# Altium project OPTICAL-FLOW-BOARD.PrjPcb
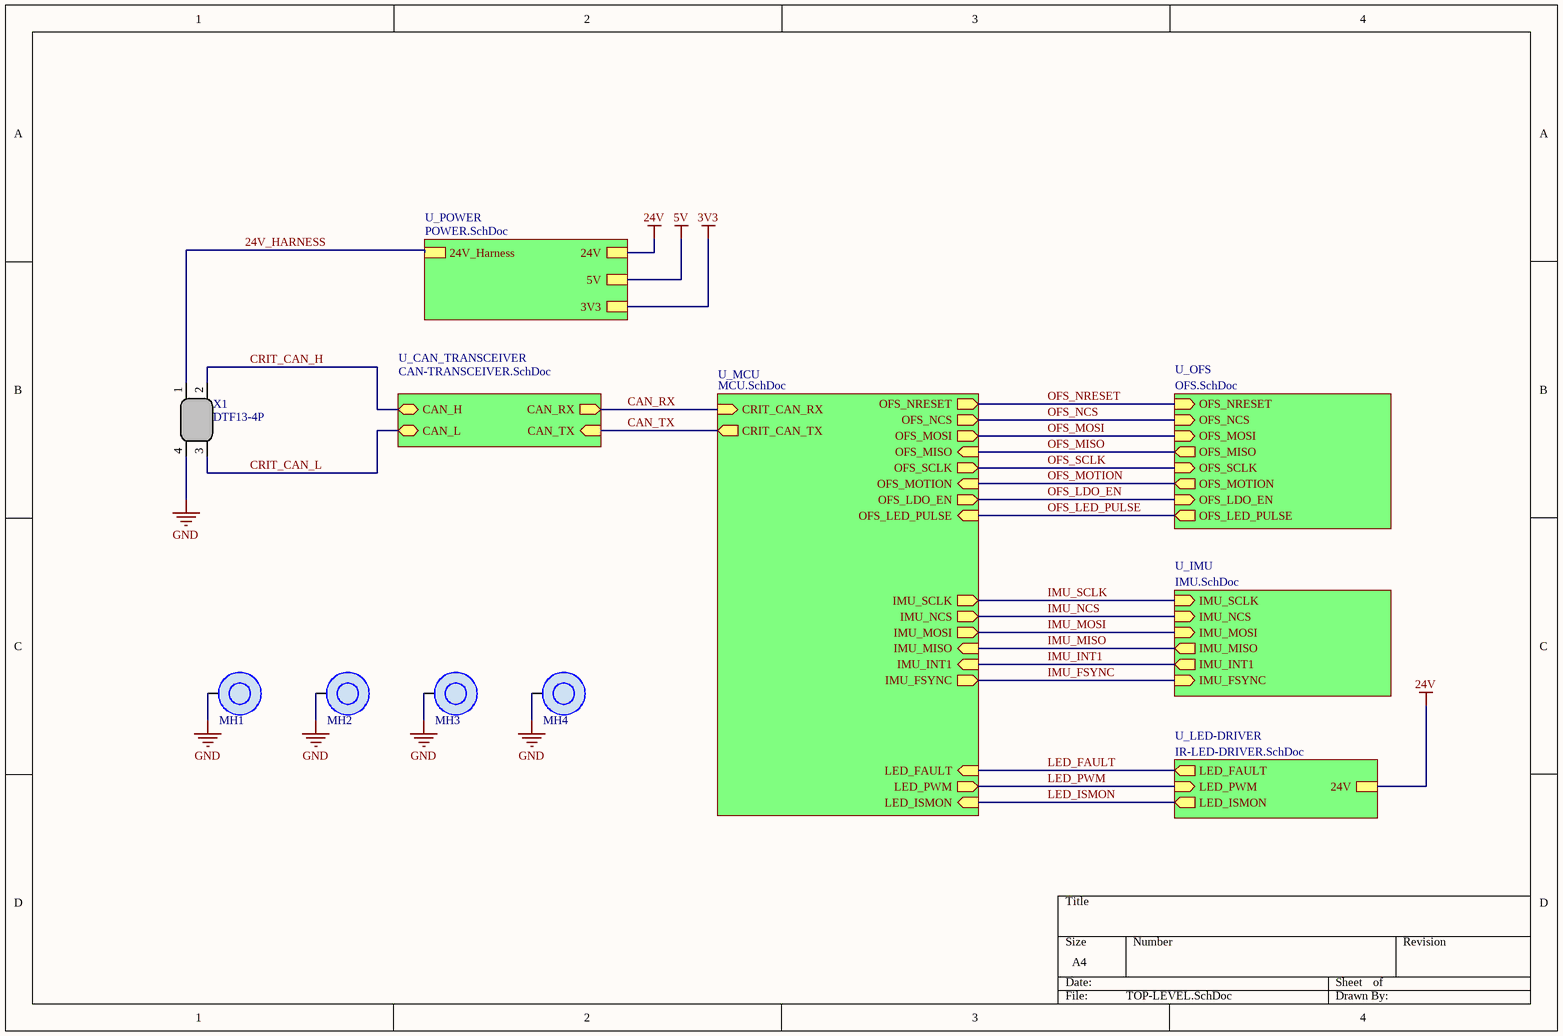
[diagram p0: TOP-LEVEL.SchDoc]
7 sheets, 111 parts. Net scope: hierarchical (ports join the sheet entries above them; power ports are global).
Board file: OFS-BOARD.PcbDoc
Sheets:
  TOP-LEVEL.SchDoc
    U_CAN_TRANSCEIVER = CAN-TRANSCEIVER.SchDoc
    U_POWER = POWER.SchDoc
    U_MCU = MCU.SchDoc
    U_OFS = OFS.SchDoc
    U_IMU = IMU.SchDoc
    U_LED-DRIVER = IR-LED-DRIVER.SchDoc

## Sheet TOP-LEVEL.SchDoc
size A4; SheetNumber: 1; SheetTotal: 7

### Parts
MH1  MOUNTING_HOLE  [MOUNTING_HOLE]  (value not drawn)
MH2  MOUNTING_HOLE  [MOUNTING_HOLE]  (value not drawn)
MH3  MOUNTING_HOLE  [MOUNTING_HOLE]  (value not drawn)
MH4  MOUNTING_HOLE  [MOUNTING_HOLE]  (value not drawn)
X1  DTF13-4P  [DTF13-4P]

### Sub-sheets
U_CAN_TRANSCEIVER = CAN-TRANSCEIVER.SchDoc: CAN_L (bidir), CAN_H (bidir), CAN_TX (in), CAN_RX (out)
U_IMU = IMU.SchDoc: IMU_SCLK (in), IMU_NCS (in), IMU_MOSI (in), IMU_MISO (out), IMU_INT1 (out), IMU_FSYNC (in)
U_LED-DRIVER = IR-LED-DRIVER.SchDoc: LED_ISMON (out), LED_FAULT (out), LED_PWM (in), 24V
U_MCU = MCU.SchDoc: CRIT_CAN_RX (in), CRIT_CAN_TX (out), OFS_NRESET (out), OFS_NCS (out), OFS_LDO_EN (out), OFS_MOTION (in), OFS_SCLK (out), OFS_MISO (in), OFS_MOSI (out), OFS_LED_PULSE (in), LED_ISMON (in), LED_PWM (out), LED_FAULT (in), IMU_FSYNC (out), IMU_INT1 (in), IMU_MISO (in), IMU_MOSI (out), IMU_NCS (out), IMU_SCLK (out)
U_OFS = OFS.SchDoc: OFS_NRESET (in), OFS_MOSI (in), OFS_SCLK (in), OFS_MOTION (out), OFS_LDO_EN (in), OFS_NCS (in), OFS_MISO (out), OFS_LED_PULSE (out)
U_POWER = POWER.SchDoc: 24V, 24V_Harness, 5V, 3V3

### Nets
24V: sheet U_POWER/24V, sheet U_LED-DRIVER/24V
GND: MH1.1 MH2.1 MH3.1 MH4.1 X1.4
24V_HARNESS: X1.1 ; sheet U_POWER/24V_Harness
CAN_RX: sheet U_CAN_TRANSCEIVER/CAN_RX, sheet U_MCU/CRIT_CAN_RX
CAN_TX: sheet U_CAN_TRANSCEIVER/CAN_TX, sheet U_MCU/CRIT_CAN_TX
CRIT_CAN_H: X1.2 ; sheet U_CAN_TRANSCEIVER/CAN_H
CRIT_CAN_L: X1.3 ; sheet U_CAN_TRANSCEIVER/CAN_L
IMU_FSYNC: sheet U_MCU/IMU_FSYNC, sheet U_IMU/IMU_FSYNC
IMU_INT1: sheet U_MCU/IMU_INT1, sheet U_IMU/IMU_INT1
IMU_MISO: sheet U_MCU/IMU_MISO, sheet U_IMU/IMU_MISO
IMU_MOSI: sheet U_MCU/IMU_MOSI, sheet U_IMU/IMU_MOSI
IMU_NCS: sheet U_MCU/IMU_NCS, sheet U_IMU/IMU_NCS
IMU_SCLK: sheet U_MCU/IMU_SCLK, sheet U_IMU/IMU_SCLK
LED_FAULT: sheet U_MCU/LED_FAULT, sheet U_LED-DRIVER/LED_FAULT
LED_ISMON: sheet U_MCU/LED_ISMON, sheet U_LED-DRIVER/LED_ISMON
LED_PWM: sheet U_MCU/LED_PWM, sheet U_LED-DRIVER/LED_PWM
OFS_LDO_EN: sheet U_MCU/OFS_LDO_EN, sheet U_OFS/OFS_LDO_EN
OFS_LED_PULSE: sheet U_MCU/OFS_LED_PULSE, sheet U_OFS/OFS_LED_PULSE
OFS_MISO: sheet U_MCU/OFS_MISO, sheet U_OFS/OFS_MISO
OFS_MOSI: sheet U_MCU/OFS_MOSI, sheet U_OFS/OFS_MOSI
OFS_MOTION: sheet U_MCU/OFS_MOTION, sheet U_OFS/OFS_MOTION
OFS_NCS: sheet U_MCU/OFS_NCS, sheet U_OFS/OFS_NCS
OFS_NRESET: sheet U_MCU/OFS_NRESET, sheet U_OFS/OFS_NRESET
OFS_SCLK: sheet U_MCU/OFS_SCLK, sheet U_OFS/OFS_SCLK

### Library data of the parts
X1 = TE_DTF13-4P: Connector Header Through Hole, Right Angle 4 position 0.175" (4.44mm); ComponentLink1Description: Datasheet; ComponentLink1URL: https://www.te.com/usa-en/product-DTF13-4P.html; ComponentLink2Description: Digikey; ComponentLink2URL: https://www.digikey.com/en/products/detail/te-connectivity-deutsch-connectors/DTF13-4P/7220163

## Sheet CAN-TRANSCEIVER.SchDoc
size A4; SheetNumber: 4; SheetTotal: 7
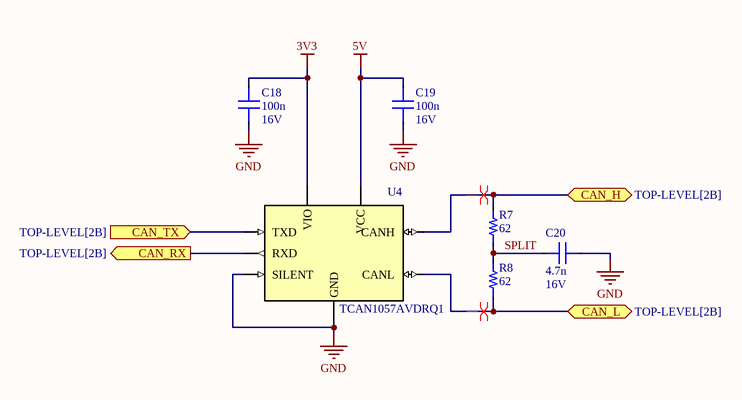
[diagram p1: CAN-TRANSCEIVER.SchDoc]

### Parts
C18  value 100n  Voltage: 16V  [0603_CAP]  (hidden comment: Capacitor)
C19  value 100n  Voltage: 16V  [0603_CAP]  (hidden comment: Capacitor)
C20  value 4.7n  Voltage: 16V  [0603_CAP]  (hidden comment: Capacitor)
R7  value 62  [0603_RES]  (hidden comment: Resistor)
R8  value 62  [0603_RES]  (hidden comment: Resistor)
U4  TCAN1057AVDRQ1  [SOIC8_D_TEX]

### Ports
CAN_H (bidir, see TOP-LEVEL[2B]), CAN_L (bidir, see TOP-LEVEL[2B]), CAN_RX (out, see TOP-LEVEL[2B]), CAN_TX (in, see TOP-LEVEL[2B])

### Nets
3V3: C18.2 U4.5(VIO)
5V: C19.2 U4.3(VCC)
GND: C18.1 C19.1 C20.2 U4.2(GND) U4.8(SILENT)
CAN_RX: U4.4(RXD) ; port CAN_RX
CAN_TX: U4.1(TXD) ; port CAN_TX
CRIT_CAN_H: R7.2 U4.7(CANH) ; port CAN_H
CRIT_CAN_L: R8.1 U4.6(CANL) ; port CAN_L
SPLIT: C20.1 R7.1 R8.2

### Layout directives
differential pair: CRIT_CAN_H, CRIT_CAN_L

### Library data of the parts
U4 = TCAN1057AVDRQ1: CAN transceiver with silent mode 8-SOIC Bus Protected; Manufacturer_Name: Texas Instruments; Type: Interface; Copyright: Copyright (C) 2025 Ultra Librarian. All rights reserved.; Manufacturer_Part_Number: TCAN1057AVDRQ1; RefDes: RefDes; ComponentLink1Description: Datasheet; ComponentLink1URL: https://www.ti.com/lit/ds/symlink/tcan1057a-q1.pdf
C18-C20 = Capacitor: Dielectric: *; Percent Tolerance: *; ESR: *
R7 R8 = Resistor: Tolerance: *

## Sheet POWER.SchDoc
size A4; SheetNumber: 5; SheetTotal: 7
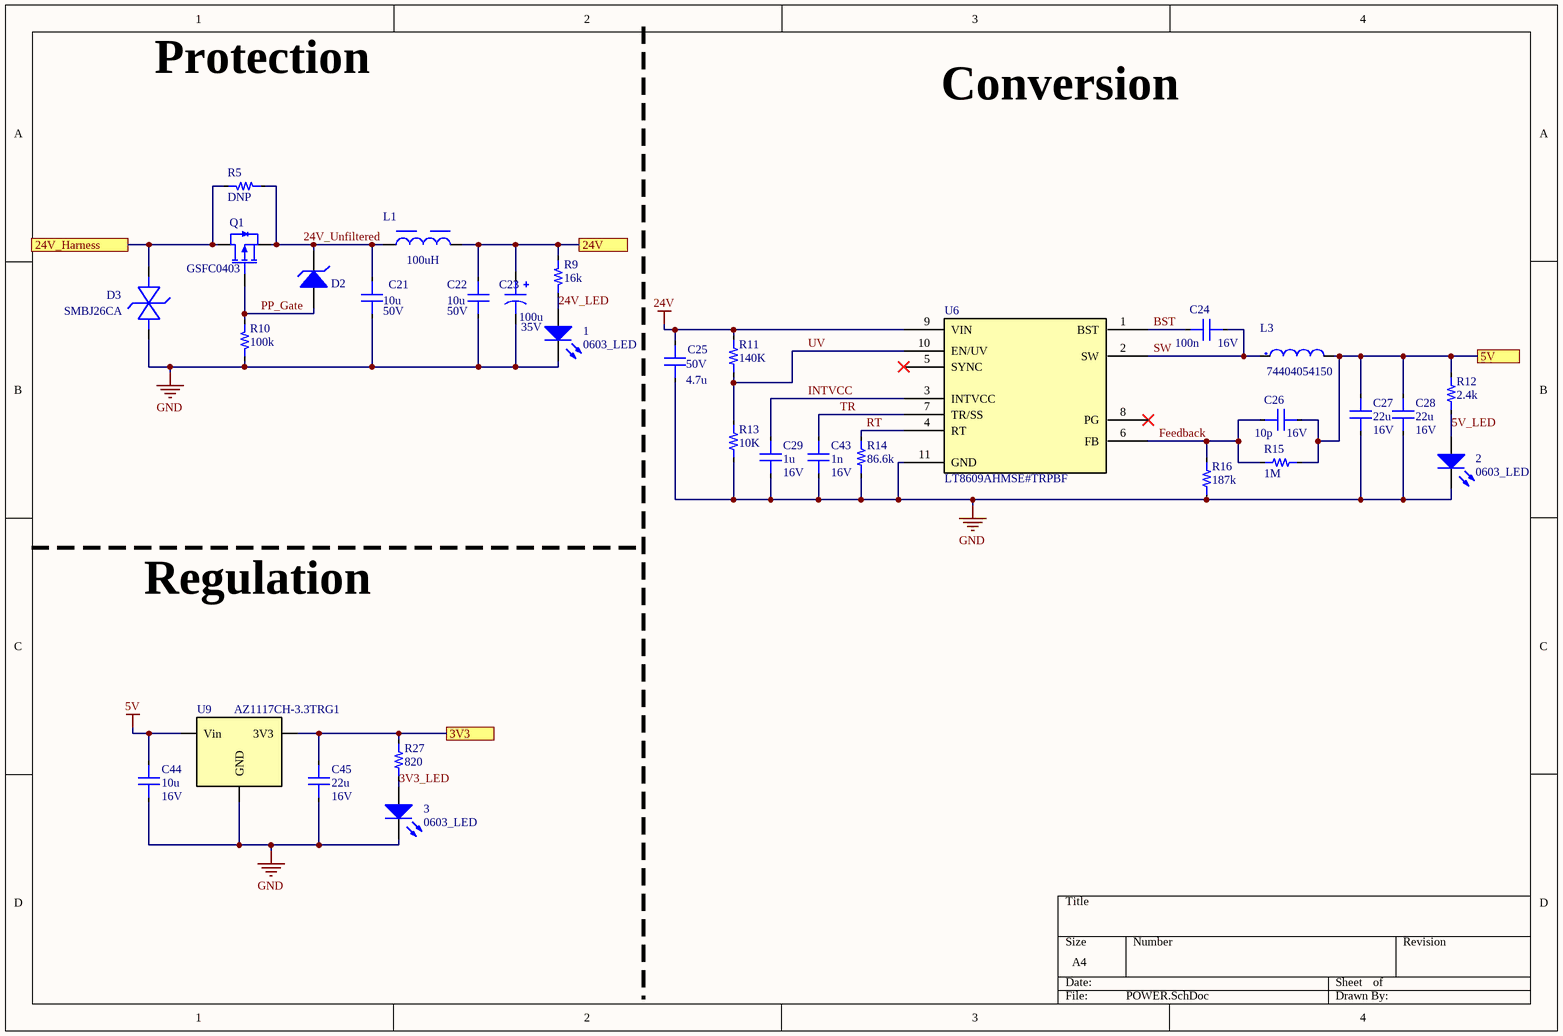
[diagram p2: POWER.SchDoc]

### Parts
1  0603_LED  [0603_LED]
2  0603_LED  [0603_LED]
3  0603_LED  [0603_LED]
C21  value 10u  Voltage: 50V  [0603_CAP]  (hidden comment: Capacitor)
C22  value 10u  Voltage: 50V  [0603_CAP]  (hidden comment: Capacitor)
C23  100u  Voltage Rating: 35V  [WCAP-PSHP_D8H8.7]
C24  value 100n  Voltage: 16V  [0603_CAP]  (hidden comment: Capacitor)
C25  Voltage: 50V  Vaule: 4.7u  [1206_CAP]  (hidden comment: GRM319R61H475KA12D)
C26  value 10p  Voltage: 16V  [0603_CAP]  (hidden comment: Capacitor)
C27  Vaule: 22u  Voltage: 16V  [1206_CAP]  (hidden comment: GRM319R61C226KE15D)
C28  Vaule: 22u  Voltage: 16V  [1206_CAP]  (hidden comment: GRM319R61C226KE15D)
C29  value 1u  Voltage: 16V  [0603_CAP]  (hidden comment: Capacitor)
C43  value 1n  Voltage: 16V  [0603_CAP]  (hidden comment: Capacitor)
C44  value 10u  Voltage: 16V  [0603_CAP]  (hidden comment: Capacitor)
C45  value 22u  Voltage: 16V  [0603_CAP]  (hidden comment: Capacitor)
D2  MMSZ5231B-7-F  [SOD-123]  (value not drawn)
D3  SMBJ26CA  [SMBJ26CA]
L1  100uH  [WE-LQS_3015]
L3  74404054150  [74404054150]
Q1  GSFC0403  [SSM3J351R,LF]
R5  value DNP  [0603_RES]  (hidden comment: Resistor)
R9  value 16k  [0603_RES]  (hidden comment: Resistor)
R10  value 100k  [0603_RES]  (hidden comment: Resistor)
R11  value 140K  [0603_RES]  (hidden comment: Resistor)
R12  value 2.4k  [0603_RES]  (hidden comment: Resistor)
R13  value 10K  [0603_RES]  (hidden comment: Resistor)
R14  value 86.6k  [0603_RES]  (hidden comment: Resistor)
R15  value 1M  [0603_RES]  (hidden comment: Resistor)
R16  value 187k  [0603_RES]  (hidden comment: Resistor)
R27  value 820  [0603_RES]  (hidden comment: Resistor)
U6  LT8609AHMSE#TRPBF  [05-08-1664_ADI]
U9  AZ1117CH-3.3TRG1  [SOT-233-4]

### Ports
3V3 (see TOP-LEVEL[2B]), 5V (see TOP-LEVEL[2B]), 24V (see TOP-LEVEL[2A], IR-LED-DRIVER[1B]), 24V_Harness (see TOP-LEVEL[2A])

### Nets
3V3: C45.2 R27.2 U9.2,_4(3V3) ; port 3V3
5V: C26.2 C27.2 C28.2 C44.2 L3.2 R12.2 R15.1 U9.3(Vin) ; port 5V
24V: C22.2 C23.1 C25.2 L1.2 R9.2 R11.2 U6.9(VIN) ; port 24V
GND: 1.1(C) 2.1(C) 3.1(C) C21.1 C22.1 C23.2 C25.1 C27.1 C28.1 C29.1 C43.1 C44.1 C45.1 D3.1 R10.1 R13.1 R14.1 R16.2 U6.11(GND) U9.1(GND)
3V3_LED: 3.2(A) R27.1
5V_LED: 2.2(A) R12.1
24V_HARNESS: D3.2 Q1.3(D) R5.2 ; port 24V_Harness
24V_LED: 1.2(A) R9.1
24V_Unfiltered: C21.2 D2.1(K) L1.1 Q1.2(S) R5.1
BST: C24.2 U6.1(BST)
Feedback: C26.1 R15.2 R16.1 U6.6(FB)
INTVCC: C29.2 U6.3(INTVCC)
PP_Gate: D2.2(A) Q1.1(G) R10.2
RT: R14.2 U6.4(RT)
SW: C24.1 L3.1 U6.2(SW)
TR: C43.2 U6.7(TR/SS)
UV: R11.1 R13.2 U6.10(EN/UV)

Not connected (* = marked no-connect by the designer): U6 5(SYNC)* 8(PG)*

### Notes on the sheet
- Protection
- Conversion
- Regulation

### Library data of the parts
1-3 = 0603_LED: WL-SMCW Mono-color Chip LED Waterclear, SMT, size 0603, Blue, 3.2V, 140°; Manufacturer Part Number: 150060BS75000; Manufacturer: Wurth Elektronik; Case/Size Code: 0603; Chip Technology: InGaN; Dominant Wavelength: 470nm; Luminous Intensity: 145mcd; Peak Wavelength: 465nm; Category: Signal LEDs; Match Code: WL-SMCW; ComponentLink1Description: Website Link; ComponentLink1URL: https://www.we-online.com/redexpert/article/150060BS75000?ad; ComponentLink2Description: Datasheet Link; ComponentLink2URL: https://www.we-online.com/redexpert/spec/150060BS75000?ad; Mount: Surface Mount; Operating Temperature Max: 85°C; Operating Temperature Min: -40°C; Packaging: Tape and Reel; Length: 1.6mm; Width: 0.8mm; Height: 0.7mm; Emitting Color: Blue; Forward Voltage: 3.2V; Viewing Angle: 140°
C23 = 875115652007: Cap, 100uf, 35V, Alu Elec Smd, Polymer Rohs Compliant Wurth Elektronik 875115652007; Pitch: 3.1mm; Capacitance: 100µF; Leakage Current: 700µA; ESR (Equivalent Series Resistance): 30mΩ; Ripple Current: 3A; Width: 8.3mm; Length: 8.7mm; Min Operating Temperature: -55°C; RoHS: Compliant; Diameter: 8mm; Max Operating Temperature: 105°C; ComponentLink1Description: Digikey; ComponentLink1URL: https://www.digikey.com/en/products/detail/würth-elektronik/875115652007/8556615
C25 = GRM319R61H475KA12D: CAP CER 4.7UF 50V X5R 1206; ComponentLink1Description: Digikey; ComponentLink1URL: https://www.digikey.com/en/products/detail/murata-electronics/GRM319R61H475KA12D/6606013
C27 C28 = GRM319R61C226KE15D: CAP CER 22UF 16V X5R 1206; ComponentLink1Description: Digikey; ComponentLink1URL: https://www.digikey.com/en/products/detail/murata-electronics/GRM319R61C226KE15D/8323879
D2 = MMSZ5231B-7-F: Zener Diode 5.1V 500mW ±5% Surface Mount SOD-123; Num_Circuits: 1; Package: SOD-123; ComponentLink1Description: Digikey; ComponentLink1URL: https://www.digikey.com/en/products/detail/diodes-incorporated/MMSZ5231B-7-F/755472
D3 = SMBJ26CA: 42.1V Clamp 14.3A Ipp Tvs Diode Surface Mount DO-214AA (SMBJ); ComponentLink1Description: Digikey; ComponentLink1URL: https://www.digikey.com/en/products/detail/littelfuse-inc/SMBJ26CA/286000
L1 = 74404032101: WE-LQS SMT Power Inductor, size 3015, 100μH, 1.9Ω; Manufacturer: Wurth Elektronik; Case/Size Code: 3015; Rated Current: 0.3A; Saturation Current: 0.26A; Self Resonant Frequency: 7.5MHz; Manufacturer Part Number: 74404032101; Category: Power Inductors; Match Code: WE-LQS; ComponentLink1Description: Website Link; ComponentLink1URL: https://www.we-online.com/redexpert/article/74404032101?ad; ComponentLink2Description: Datasheet Link; ComponentLink2URL: https://www.we-online.com/redexpert/spec/74404032101?ad; Mount: Surface Mount; Min Operating Temperature: -40°C; Max Operating Temperature: 125°C; Packaging: Tape and Reel; Length: 3mm; Width: 3mm; Height: 1.5mm; DC Resistance: 1.9Ω; Inductance: 100μH
L3 = 74404054150: Inductor Power Semi-Shielded Wirewound 15uH 20% 100KHz 2A 0.086Ohm DCR 2020 Automotive T/R; Saturation Current: 2.2A; Core Material: Ferrite; DC Resistance (DCR): 86mΩ; Self Resonant Frequency: 22MHz; Inductance: 15µH; Width: 5mm; Max Operating Temperature: 125°C; Case/Package: Nonstandard; REACH SVHC: Unknown; Height: 4mm; Min Operating Temperature: -40°C; Composition: Wirewound; Height - Seated (Max): 3.9878mm; RMS Current (Irms): 2A; Max DC Current: 2A; Length: 5mm; Inductance Tolerance: 20%; Test Frequency: 100kHz; Mount: Surface Mount; Termination: SMD/SMT; Tolerance: 20%; Current Rating: 2A; Ambient Temperature Range Low: -40°C; Ambient Temperature Range High: 85°C; RoHS: Compliant; Shielding: Shielded; ComponentLink1Description: Digikey; ComponentLink1URL: https://www.digikey.com/en/products/detail/würth-elektronik/74404054150/4865666
Q1 = GSFC0403: MOSFET P-CH 40V 2.9A SOT-23F; ComponentLink1Description: Digikey; ComponentLink1URL: https://goodarksemi.com/docs/datasheets/mosfets/GSFC0403.pdf
U6 = LT8609AHMSETRPBF: Buck Switching Regulator IC Positive Adjustable 0.782V 1 Output 3A 10-TFSOP, 10-MSOP (0.118", 3.00mm Width) Exposed Pad; Manufacturer_Name: Analog Devices Inc; Type: Power Management; Copyright: Copyright (C) 2025 Ultra Librarian. All rights reserved.; Manufacturer_Part_Number: LT8609AHMSE#TRPBF; RefDes: RefDes
U9 = AZ1117CH-3.3TRG1: No Description Available; Manufacturer_Name: Diodes Inc; Copyright: Copyright (C) 2025 Ultra Librarian. All rights reserved.; Manufacturer_Part_Number: AZ1117CH-3.3TRG1; RefDes: RefDes; Type: Type
C21 C22 C24 C26 C29 C43-C45 = Capacitor: Dielectric: *; Percent Tolerance: *; ESR: *
R5 R9-R16 R27 = Resistor: Tolerance: *

## Sheet MCU.SchDoc
size A4; SheetNumber: 2; SheetTotal: 7
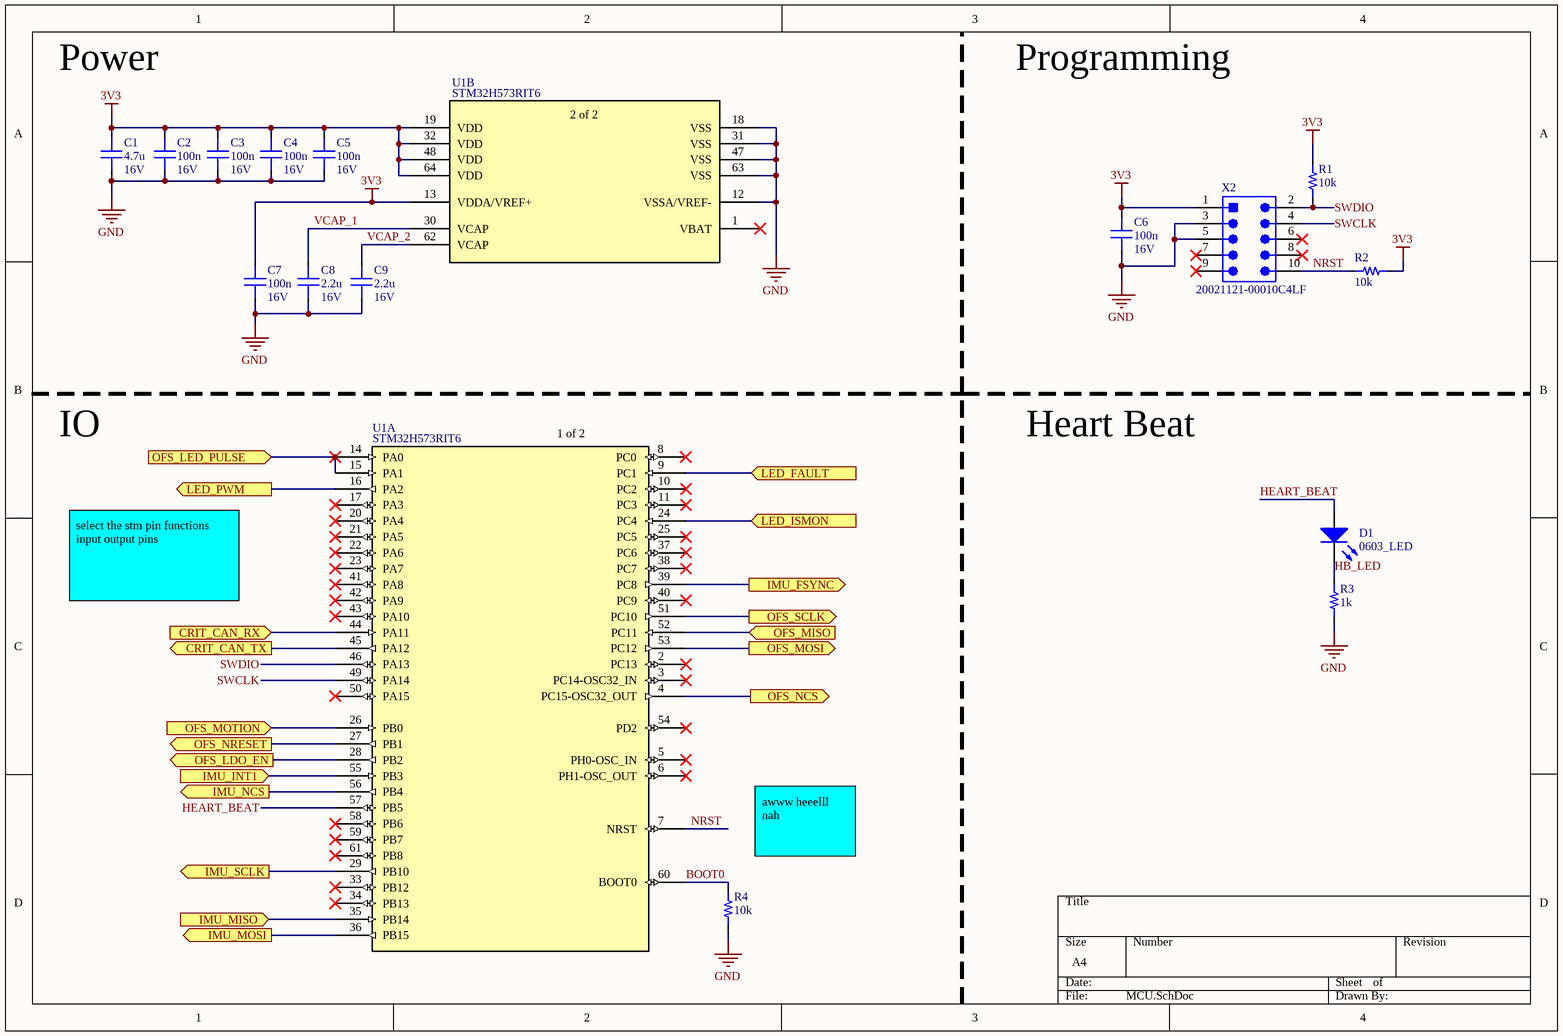
[diagram p3: MCU.SchDoc]

### Parts
C1  value 4.7u  Voltage: 16V  [0603_CAP]  (hidden comment: Capacitor)
C2  value 100n  Voltage: 16V  [0603_CAP]  (hidden comment: Capacitor)
C3  value 100n  Voltage: 16V  [0603_CAP]  (hidden comment: Capacitor)
C4  value 100n  Voltage: 16V  [0603_CAP]  (hidden comment: Capacitor)
C5  value 100n  Voltage: 16V  [0603_CAP]  (hidden comment: Capacitor)
C6  value 100n  Voltage: 16V  [0603_CAP]  (hidden comment: Capacitor)
C7  value 100n  Voltage: 16V  [0603_CAP]  (hidden comment: Capacitor)
C8  value 2.2u  Voltage: 16V  [0603_CAP]  (hidden comment: Capacitor)
C9  value 2.2u  Voltage: 16V  [0603_CAP]  (hidden comment: Capacitor)
D1  0603_LED  [0603_LED]
R1  value 10k  [0603_RES]  (hidden comment: Resistor)
R2  value 10k  [0603_RES]  (hidden comment: Resistor)
R3  value 1k  [0603_RES]  (hidden comment: Resistor)
R4  value 10k  [0603_RES]  (hidden comment: Resistor)
U1  STM32H573RIT6  [LQFP64-10x10mm_STM]  (parts A,B of 2)
X2  20021121-00010C4LF  [HDR2X5_SMT]

### Ports
CRIT_CAN_RX (in, see TOP-LEVEL[2B]), CRIT_CAN_TX (out, see TOP-LEVEL[2B]), IMU_FSYNC (out, see TOP-LEVEL[3C], IMU[1B]), IMU_INT1 (in, see TOP-LEVEL[3C], IMU[1B]), IMU_MISO (in, see TOP-LEVEL[3C], IMU[3B]), IMU_MOSI (out, see TOP-LEVEL[3C], IMU[3B]), IMU_NCS (out, see TOP-LEVEL[3C], IMU[1B]), IMU_SCLK (out, see TOP-LEVEL[3C], IMU[3B]), LED_FAULT (in, see TOP-LEVEL[3C], IR-LED-DRIVER[2C]), LED_ISMON (in, see TOP-LEVEL[3D], IR-LED-DRIVER[3B]), LED_PWM (out, see TOP-LEVEL[3D], IR-LED-DRIVER[1B]), OFS_LDO_EN (out, see TOP-LEVEL[3B], OFS[3C]), OFS_LED_PULSE (in, see TOP-LEVEL[3B], OFS[4B]), OFS_MISO (in, see TOP-LEVEL[3B], OFS[3C]), OFS_MOSI (out, see TOP-LEVEL[3B], OFS[3C]), OFS_MOTION (in, see TOP-LEVEL[3B], OFS[3C]), OFS_NCS (out, see TOP-LEVEL[3B], OFS[3B]), OFS_NRESET (out, see TOP-LEVEL[3B], OFS[3B]), OFS_SCLK (out, see TOP-LEVEL[3B], OFS[3C])

### Nets
3V3: C1.1 C2.1 C3.1 C4.1 C5.1 C6.1 C7.1 R1.1 R2.2 U1.13(VDDA/VREF+) U1.19(VDD) U1.32(VDD) U1.48(VDD) U1.64(VDD) X2.1
GND: C1.2 C2.2 C3.2 C4.2 C5.2 C6.2 C7.2 C8.2 C9.2 R3.1 R4.1 U1.12(VSSA/VREF-) U1.18(VSS) U1.31(VSS) U1.47(VSS) U1.63(VSS) X2.3 X2.5
BOOT0: R4.2 U1.60(BOOT0)
CAN_RX: U1.44(PA11) ; port CRIT_CAN_RX
CAN_TX: U1.45(PA12) ; port CRIT_CAN_TX
HB_LED: D1.1(C) R3.2
HEART_BEAT: D1.2(A) U1.57(PB5)
IMU_FSYNC: U1.39(PC8) ; port IMU_FSYNC
IMU_INT1: U1.55(PB3) ; port IMU_INT1
IMU_MISO: U1.35(PB14) ; port IMU_MISO
IMU_MOSI: U1.36(PB15) ; port IMU_MOSI
IMU_NCS: U1.56(PB4) ; port IMU_NCS
IMU_SCLK: U1.29(PB10) ; port IMU_SCLK
LED_FAULT: U1.9(PC1) ; port LED_FAULT
LED_ISMON: U1.24(PC4) ; port LED_ISMON
LED_PWM: U1.16(PA2) ; port LED_PWM
NRST: R2.1 U1.7(NRST) X2.10
OFS_LDO_EN: U1.28(PB2) ; port OFS_LDO_EN
OFS_LED_PULSE: U1.14(PA0) U1.15(PA1) ; port OFS_LED_PULSE
OFS_MISO: U1.52(PC11) ; port OFS_MISO
OFS_MOSI: U1.53(PC12) ; port OFS_MOSI
OFS_MOTION: U1.26(PB0) ; port OFS_MOTION
OFS_NCS: U1.4(PC15-OSC32_OUT) ; port OFS_NCS
OFS_NRESET: U1.27(PB1) ; port OFS_NRESET
OFS_SCLK: U1.51(PC10) ; port OFS_SCLK
SWCLK: U1.49(PA14) X2.4
SWDIO: R1.2 U1.46(PA13) X2.2
VCAP_1: C8.1 U1.30(VCAP)
VCAP_2: C9.1 U1.62(VCAP)

Not connected (* = marked no-connect by the designer): U1 1(VBAT)* 2(PC13)* 3(PC14-OSC32_IN)* 5(PH0-OSC_IN)* 6(PH1-OSC_OUT)* 8(PC0)* 10(PC2)* 11(PC3)* 17(PA3)* 20(PA4)* 21(PA5)* 22(PA6)* 23(PA7)* 25(PC5)* 33(PB12)* 34(PB13)* 37(PC6)* 38(PC7)* 40(PC9)* 41(PA8)* 42(PA9)* 43(PA10)* 50(PA15)* 54(PD2)* 58(PB6)* 59(PB7)* 61(PB8)*; X2 6* 7* 8* 9*

### Notes on the sheet
- Power
- Programming
- IO
- Heart Beat
- select the stm pin functions
  input output pins
- (near R4) awww heeelll nah
- (in symbol STM32H573RIT6, part A) 1 of 2
- (in symbol STM32H573RIT6, part B) 2 of 2

### Library data of the parts
D1 = 0603_LED: as 1 on sheet POWER; Category: Signal LEDs; Match Code: WL-SMCW; ComponentLink1Description: Website Link; ComponentLink1URL: https://www.we-online.com/redexpert/article/150060BS75000?ad; ComponentLink2Description: Datasheet Link; ComponentLink2URL: https://www.we-online.com/redexpert/spec/150060BS75000?ad; Mount: Surface Mount; Operating Temperature Max: 85°C; Operating Temperature Min: -40°C; Packaging: Tape and Reel; Length: 1.6mm; Width: 0.8mm; Height: 0.7mm; Emitting Color: Blue; Forward Voltage: 3.2V; Viewing Angle: 140°
U1 = STM32H573RIT6: Mfr_Name: STMicroelectronics; RefDes: RefDes; Type: Type
X2 = 20021121-00010C4LF: Header, 10-Leads, Body 3.43x6.35mm, Pitch 1.27mm; Circuits: 10; Name: 20021121-00010C4LF; ComponentLink1Description: Digikey; ComponentLink1URL: https://www.digikey.com/product-detail/en/amphenol-icc-fci/20021121-00010C4LF/609-3695-1-ND/2209147
C1-C9 = Capacitor: Dielectric: *; Percent Tolerance: *; ESR: *
R1-R4 = Resistor: Tolerance: *

## Sheet OFS.SchDoc
size A4; SheetNumber: 3; SheetTotal: 7
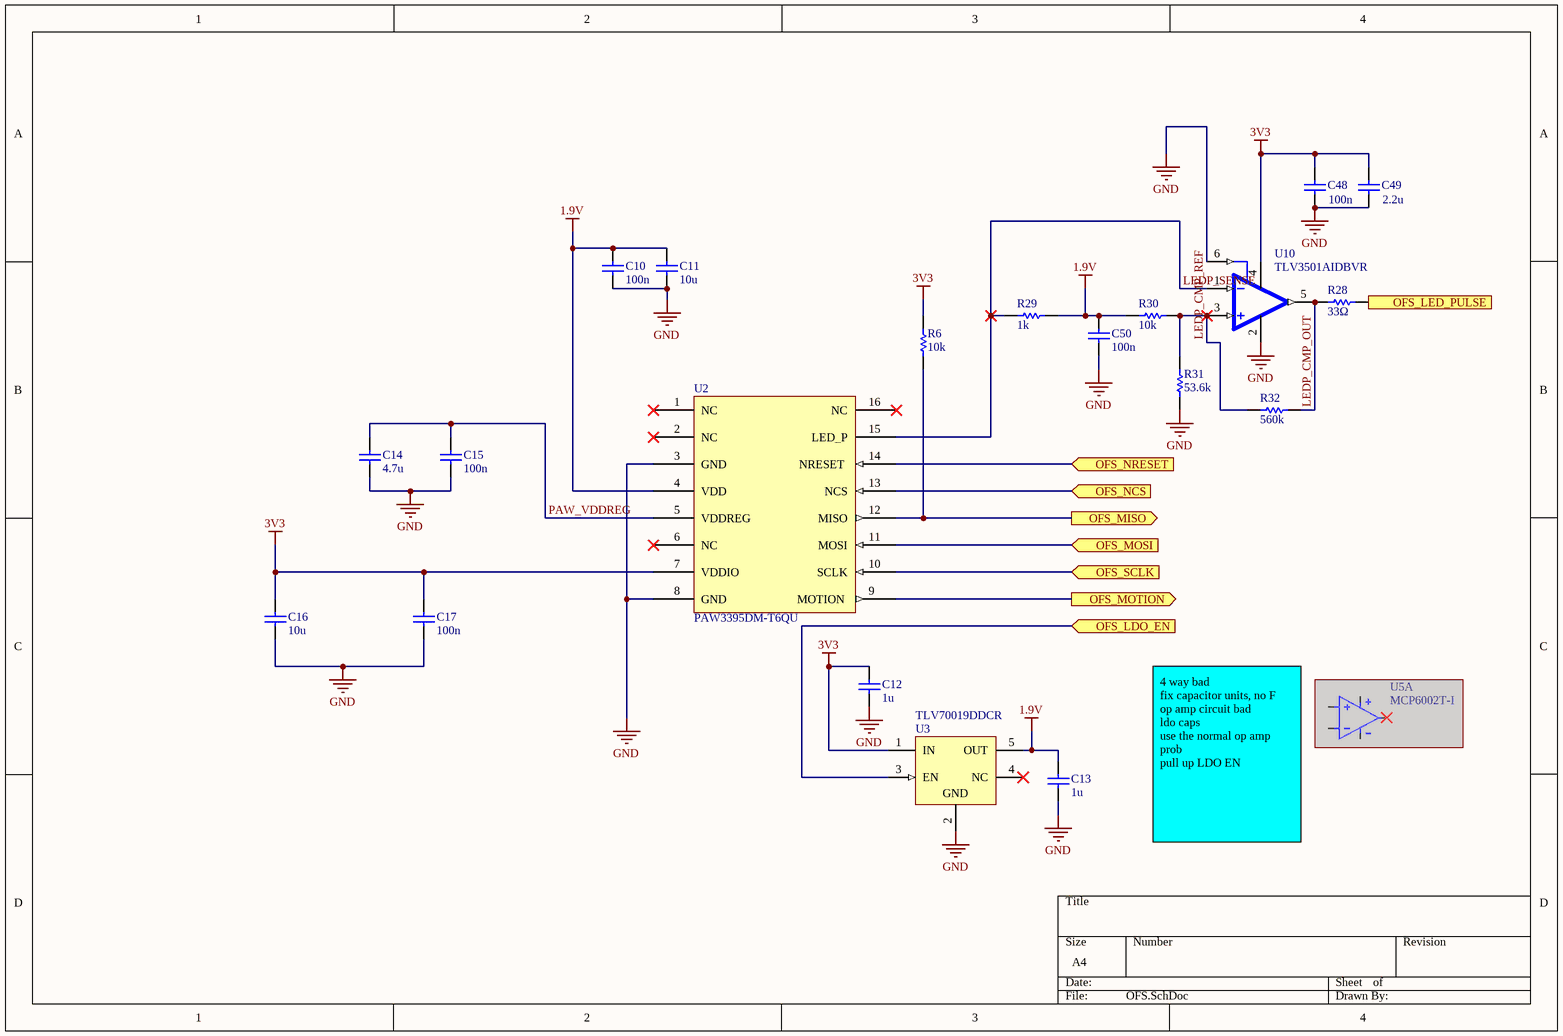
[diagram p4: OFS.SchDoc]

### Parts
C10  value 100n  [0603_CAP]  (hidden comment: Capacitor)
C11  value 10u  [0603_CAP]  (hidden comment: Capacitor)
C12  value 1u  [0603_CAP]  (hidden comment: Capacitor)
C13  value 1u  [0603_CAP]  (hidden comment: Capacitor)
C14  value 4.7u  [0603_CAP]  (hidden comment: Capacitor)
C15  value 100n  [0603_CAP]  (hidden comment: Capacitor)
C16  value 10u  [0603_CAP]  (hidden comment: Capacitor)
C17  value 100n  [0603_CAP]  (hidden comment: Capacitor)
C48  value 100n  [0603_CAP]  (hidden comment: Capacitor)
C49  value 2.2u  [0603_CAP]  (hidden comment: Capacitor)
C50  value 100n  [0603_CAP]  (hidden comment: Capacitor)
R6  value 10k  [0603_RES]  (hidden comment: Resistor)
R28  value 33Ω  [0603_RES]  (hidden comment: Resistor)
R29  value 1k  [0603_RES]  (hidden comment: Resistor)
R30  value 10k  [0603_RES]  (hidden comment: Resistor)
R31  value 53.6k  [0603_RES]  (hidden comment: Resistor)
R32  value 560k  [0603_RES]  (hidden comment: Resistor)
U2  PAW3395DM-T6QU  [PAW3395DM-T6QU]
U3  TLV70019DDCR  [DDC0005A_L]
U5  MCP6002T-I  [SOIC-8]  (part A of 2)  (masked out: inside a compile mask, not in the netlist)
U10  TLV3501AIDBVR  [SOT95P280X145-6N]

### Ports
OFS_LDO_EN (in, see TOP-LEVEL[4B], MCU[1C]), OFS_LED_PULSE (out, see TOP-LEVEL[4B], MCU[1B]), OFS_MISO (out, see TOP-LEVEL[4B], MCU[2C]), OFS_MOSI (in, see TOP-LEVEL[4B], MCU[2C]), OFS_MOTION (out, see TOP-LEVEL[4B], MCU[1C]), OFS_NCS (in, see TOP-LEVEL[4B], MCU[2C]), OFS_NRESET (in, see TOP-LEVEL[4B], MCU[1C]), OFS_SCLK (in, see TOP-LEVEL[4B], MCU[2C])

### Nets
1.9V: C10.2 C11.2 C13.2 C50.2 R29.1 R30.2 U2.4(VDD) U3.5(OUT)
3V3: C12.2 C16.2 C17.2 C48.2 C49.2 R6.2 U2.7(VDDIO) U3.1(IN) U10.4(V+)
GND: C10.1 C11.1 C12.1 C13.1 C14.1 C15.1 C16.1 C17.1 C48.1 C49.1 C50.1 R31.2 U2.3(GND) U2.8(GND) U3.2(GND) U10.2(V-) U10.6(SHDN)
LEDP_CMP_OUT: R28.2 R32.1 U10.5(OUT)
LEDP_CMP_REF: R30.1 R31.1 R32.2 U10.3(+IN)
LEDP_SENSE: R29.2 U2.15(LED_P) U10.1(-IN)
OFS_LDO_EN: U3.3(EN) ; port OFS_LDO_EN
OFS_LED_PULSE: R28.1 ; port OFS_LED_PULSE
OFS_MISO: R6.1 U2.12(MISO) ; port OFS_MISO
OFS_MOSI: U2.11(MOSI) ; port OFS_MOSI
OFS_MOTION: U2.9(MOTION) ; port OFS_MOTION
OFS_NCS: U2.13(NCS) ; port OFS_NCS
OFS_NRESET: U2.14(NRESET) ; port OFS_NRESET
OFS_SCLK: U2.10(SCLK) ; port OFS_SCLK
PAW_VDDREG: C14.2 C15.2 U2.5(VDDREG)

Not connected (* = marked no-connect by the designer): U2 1(NC)* 2(NC)* 6(NC)* 16(NC)*; U3 4(NC)*

### Notes on the sheet
- (near U5) 4 way bad
  fix capacitor units, no F
  op amp circuit bad
  ldo caps
  use the normal op amp prob
  pull up LDO EN

### Library data of the parts
C10-C17 C48-C50 = Capacitor: SimulationGenericComponent: True
R6 R28-R32 = Resistor: TC1: 0; SimulationGenericComponent: True; TC2: 0
U2 = PAW3395DM-T6QU: PixArt PAW3395DM-T6QU optical navigation sensor, 16-pin molded lead-frame DIP, 1.78mm pitch staggered dual row, 10.7mm row spacing, through-hole
U3 = CMP-0394-01054-2: Single Output LDO, 200 mA, Fixed 1.9 V Output, 2 to 5.5 V Input, with Low IQ, 5-pin SOT (DDC), -40 to 125 degC, Green (RoHS & no Sb/Br); Manufacturer: Texas Instruments; Iq(Typ)(mA): 0.03; Vin(Max)(V): 5.5; Accuracy(%): 2; Vout Adj(Min)(V): 1.9; Iout(Max)(A): 0.2; SubFamily: Single Channel LDO; Vdo(Typ)(mV): 175; ComponentLink2Description: Datasheet; PackageReference: DDC0005A; DatasheetVersion: SLVSA00D; ComponentLink3Description: Package Specification; ComponentLink2URL: http://www.ti.com/general/docs/lit/getliterature.tsp?genericPartNumber=TLV70019&fileType=pdf; PartNumber: TLV70019DDCR; PackageVersion: 4204403-2/E; Code_JEDEC: MO-193; ComponentLink1URL: http://www.ti.com/; Eco-Plan: Green (RoHS & no Sb/Br); PackageDescription: 5-Pin Plastic Small Outline, Body 2.9 x 1.6 mm, 0.95 mm Pitch; Fixed Output Options(V): 1.9; Vout Adj(Max)(V): 1.9; Vin(Min)(V): 2; Mounting Technology: Surface Mount; ComponentLink1Description: Manufacturer URL; ComponentLink3URL: http://www.ti.com/litv/pdf/mpds123d
U5 = MCP6002T-I: Num_Circuits: 2; Voltage: 6; Link: https://www.digikey.com/product-detail/en/microchip-technology/MCP6002T-I-SN/MCP6002T-I-SNCT-ND/4307905
U10 = TLV3501AIDBVR: 4.5ns, Rail-to-Rail, High Speed Comparator with Shutdown; MF: Texas Instruments; SnapEDA_Link: https://www.snapeda.com/parts/TLV3501AIDBVR/Texas+Instruments/view-part/?ref=snap; Package: SOT-23-6 Texas Instruments; Value: *; MP: TLV3501AIDBVR; Check_prices: https://www.snapeda.com/parts/TLV3501AIDBVR/Texas+Instruments/view-part/?ref=eda

## Sheet IMU.SchDoc
size A4; SheetNumber: 6; SheetTotal: 7
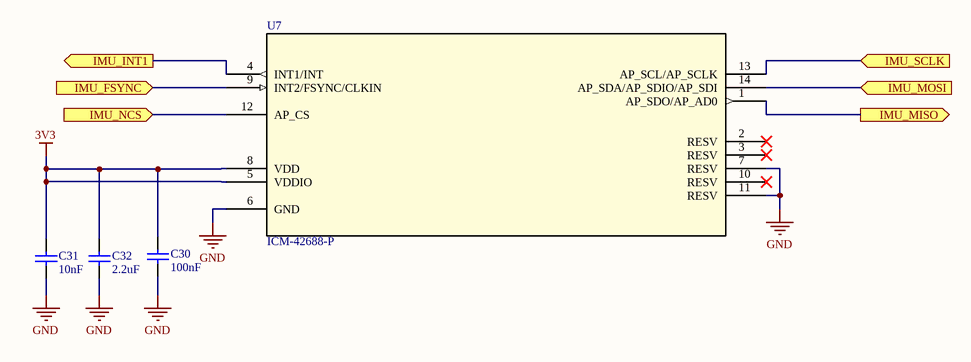
[diagram p5: IMU.SchDoc]

### Parts
C30  value 100nF  [0603_CAP]  (hidden comment: Capacitor)
C31  value 10nF  [0603_CAP]  (hidden comment: Capacitor)
C32  value 2.2uF  [0603_CAP]  (hidden comment: Capacitor)
U7  ICM-42688-P  [LGA14_2P5X3X0P91_TDK]

### Ports
IMU_FSYNC (in, see TOP-LEVEL[4C], MCU[2C]), IMU_INT1 (out, see TOP-LEVEL[4C], MCU[1D]), IMU_MISO (out, see TOP-LEVEL[4C], MCU[1D]), IMU_MOSI (in, see TOP-LEVEL[4C], MCU[1D]), IMU_NCS (in, see TOP-LEVEL[4C], MCU[1D]), IMU_SCLK (in, see TOP-LEVEL[4C], MCU[1D])

### Nets
3V3: C30.2 C31.2 C32.2 U7.5(VDDIO) U7.8(VDD)
GND: C30.1 C31.1 C32.1 U7.6(GND) U7.7(RESV) U7.11(RESV)
IMU_FSYNC: U7.9(INT2/FSYNC/CLKIN) ; port IMU_FSYNC
IMU_INT1: U7.4(INT1/INT) ; port IMU_INT1
IMU_MISO: U7.1(AP_SDO/AP_AD0) ; port IMU_MISO
IMU_MOSI: U7.14(AP_SDA/AP_SDIO/AP_SDI) ; port IMU_MOSI
IMU_NCS: U7.12(AP_CS) ; port IMU_NCS
IMU_SCLK: U7.13(AP_SCL/AP_SCLK) ; port IMU_SCLK

Not connected (* = marked no-connect by the designer): U7 2(RESV)* 3(RESV)* 10(RESV)*

### Library data of the parts
C30-C32 = Capacitor: SimulationGenericComponent: True
U7 = ICM-42688-P: Description; Manufacturer_Name: TDK; Type: Motion Sensors; Copyright: Copyright (C) 2025 Ultra Librarian. All rights reserved.; Manufacturer_Part_Number: ICM-42688-P; RefDes: RefDes

## Sheet IR-LED-DRIVER.SchDoc
size A4; SheetNumber: 7; SheetTotal: 7
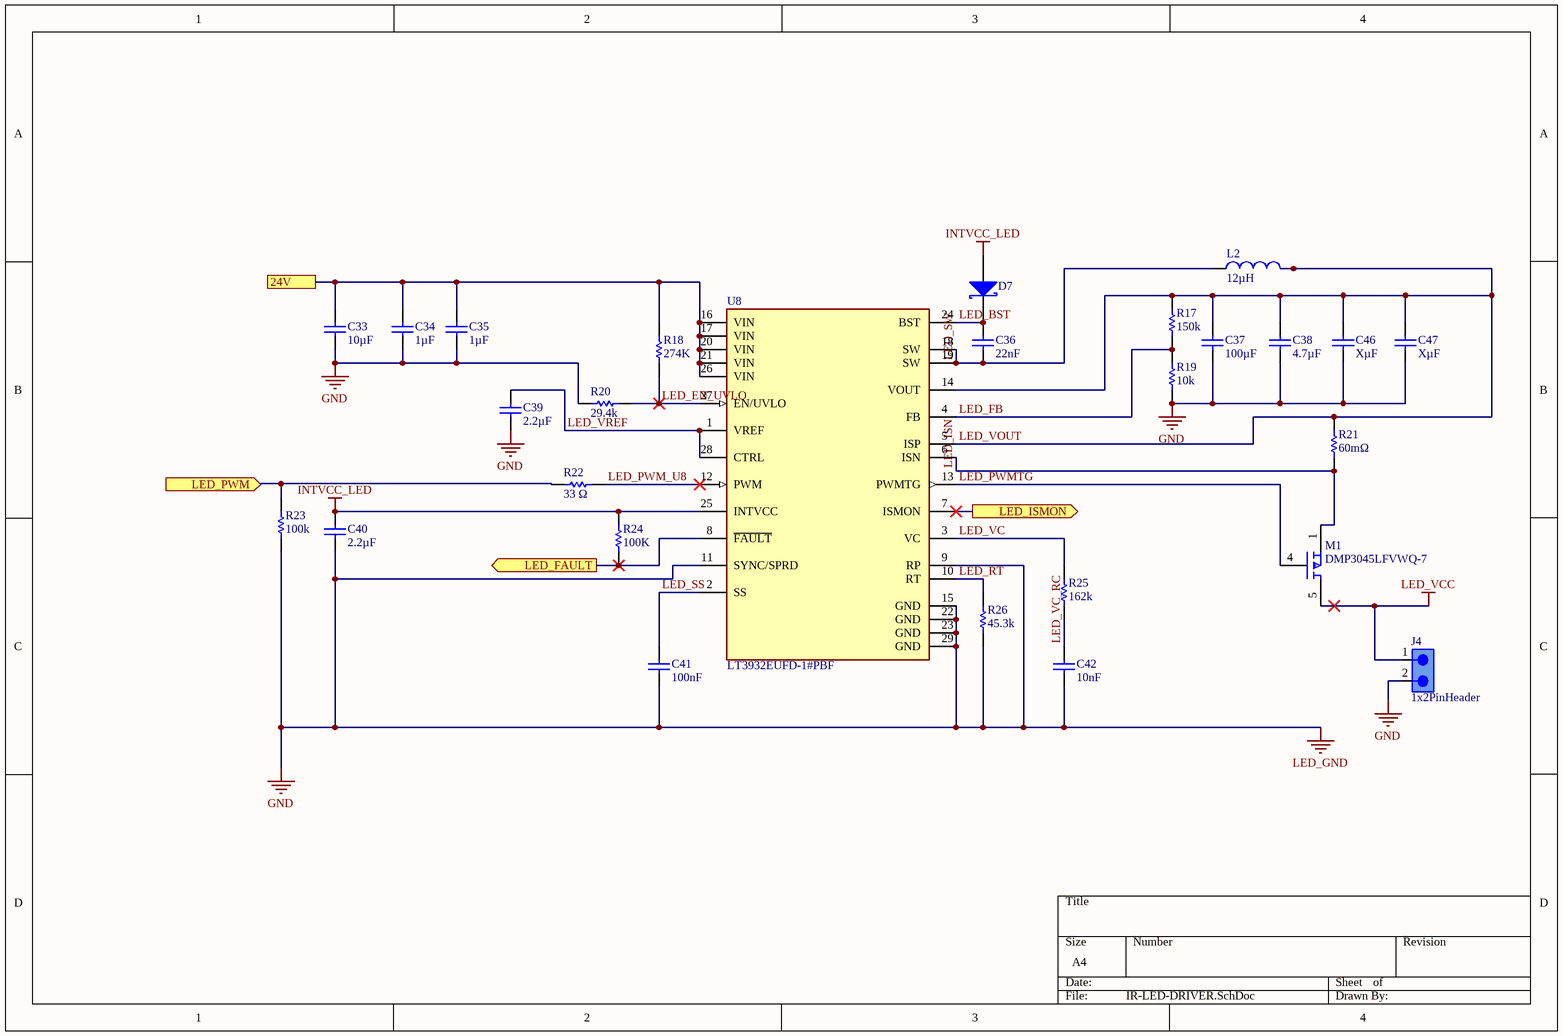
[diagram p6: IR-LED-DRIVER.SchDoc]

### Parts
C33  value 10µF  [1210_CAP]  (hidden comment: Capacitor)
C34  value 1µF  [0805_CAP]  (hidden comment: Capacitor)
C35  value 1µF  [0805_CAP]  (hidden comment: Capacitor)
C36  value 22nF  [0603_CAP]  (hidden comment: Capacitor)
C37  value 100µF  [CAP_EEH-ZC1E101XP]  (hidden comment: Capacitor)
C38  value 4.7µF  [1210_CAP]  (hidden comment: Capacitor)
C39  value 2.2µF  [0603_CAP]  (hidden comment: Capacitor)
C40  value 2.2µF  [0603_CAP]  (hidden comment: Capacitor)
C41  value 100nF  [0603_CAP]  (hidden comment: Capacitor)
C42  value 10nF  [0603_CAP]  (hidden comment: Capacitor)
C46  value XµF  [1210_CAP]  (hidden comment: Capacitor)
C47  value XµF  [1210_CAP]  (hidden comment: Capacitor)
D7  BAT46WJ,115  [SC-90_SOD323F_NEX]  (value not drawn)
J4  1x2PinHeader  [1x2PinHeader]
L2  value 12µH  [IND_SRP1038WA-6R8M_BRN]  (hidden comment: Inductor)
M1  DMP3045LFVWQ-7  [PowerDI3333-8_PMOS]
R17  value 150k  [0603_RES]  (hidden comment: Resistor)
R18  value 274K  [0603_RES]  (hidden comment: Resistor)
R19  value 10k  [0603_RES]  (hidden comment: Resistor)
R20  value 29.4k  [0603_RES]  (hidden comment: Resistor)
R21  value 60mΩ  [1206_RES]  (hidden comment: Resistor)
R22  value 33 Ω  [0603_RES]  (hidden comment: Resistor)
R23  value 100k  [0603_RES]  (hidden comment: Resistor)
R24  value 100K  [0603_RES]  (hidden comment: Resistor)
R25  value 162k  [0603_RES]  (hidden comment: Resistor)
R26  value 45.3k  [0603_RES]  (hidden comment: Resistor)
U8  LT3932EUFD-1#PBF  [FP-UFD-28-05-08-1712-IPC_C]

### Ports
24V (see TOP-LEVEL[4D], POWER[2A]), LED_FAULT (out, see TOP-LEVEL[4C], MCU[2B]), LED_ISMON (out, see TOP-LEVEL[4D], MCU[2C]), LED_PWM (in, see TOP-LEVEL[4D], MCU[1B])

### Nets
24V: C33.1 C34.1 C35.1 R18.2 U8.16(VIN) U8.17(VIN) U8.20(VIN) U8.21(VIN) U8.26(VIN) ; port 24V
GND: C33.2 C34.2 C35.2 C37.2 C38.2 C39.2 C40.2 C41.2 C42.2 C46.2 C47.2 J4.2 R19.1 R20.2 R23.2 R26.1 U8.9(RP) U8.11(SYNC/SPRD) U8.15(GND) U8.22(GND) U8.23(GND) U8.29(GND)  [also labelled LED_GND]
INTVCC_LED: C40.1 D7.1(A) R24.2 U8.25(INTVCC)
LED_VCC: J4.1 M1.5(D)
LED_BST: C36.1 D7.2(K) U8.24(BST)
LED_EN_UVLO: R18.1 R20.1 U8.27(EN/UVLO)
LED_FAULT: R24.1 U8.8(~{FAULT}) ; port LED_FAULT
LED_FB: R17.1 R19.2 U8.4(FB)
LED_ISMON: U8.7(ISMON) ; port LED_ISMON
LED_ISN: M1.1(S) R21.1 U8.6(ISN)
LED_PWM: R22.1 R23.1 ; port LED_PWM
LED_PWM_U8: R22.2 U8.12(PWM)
LED_PWMTG: M1.4(G) U8.13(PWMTG)
LED_RT: R26.2 U8.10(RT)
LED_SS: C41.1 U8.2(SS)
LED_SW: C36.2 L2.1 U8.18(SW) U8.19(SW)
LED_VC: R25.2 U8.3(VC)
LED_VC_RC: C42.1 R25.1
LED_VOUT: C37.1 C38.1 C46.1 C47.1 L2.2 R17.2 R21.2 U8.5(ISP) U8.14(VOUT)
LED_VREF: C39.1 U8.1(VREF) U8.28(CTRL)

### Library data of the parts
C33-C42 C46 C47 = Capacitor: SimulationGenericComponent: True
D7 = Schottky Diode: AF: 1; BV: 0; BV_MAX: 1e99; EG: 1.11; FC: 0.5; IBV: 0.001; IS: 1e-14; MJSW: 0.33; NTUN: 30; TNOM: 27; XTI: 3; SimulationGenericComponent: True; CJO: 0; CJP: 0; CTA: 0; CTP: 0; FCS: 0.5; FV_MAX: 1e99; IKF: 0; IKR: 0; ISR: 1e-14; JSW: 0; JTUN: 0; JTUNSW: 0; KEG: 1; KF: 0; LEVEL: 1; N: 1; NBV: 1; NR: 1; NS: 1; PHP: 1; RS: 0; TCV: 0; TLEV: 0; TLEVC: 0; TM1: 0; TM2: 0; TPB: 0; TPHP: 0; TRS: 0; TRS2: 0; TT: 0; TTT1: 0; TTT2: 0; VJ: 1; XTITUN: 3
L2 = Inductor: SimulationGenericComponent: True
M1 = DMP3045LFVWQ-7: P-channel MOSFET 30V 5.7A, PowerDI3333-8 (pins 1-3 S, 4 G, 5-8 + pad D)
R17-R26 = Resistor: TC1: 0; SimulationGenericComponent: True; TC2: 0
U8 = CMP-09135-000017-1: 40V, 2A MONOLITHIC SYNCHRONOUS S; RoHS Compliant: Yes

## Nets that join several sheets
3V3: CAN-TRANSCEIVER (C18.2 U4.5), POWER (C45.2 R27.2 U9.2, 4), MCU (15 pins), OFS (9 pins), IMU (5 pins)
5V: CAN-TRANSCEIVER (C19.2 U4.3), POWER (8 pins)
24V: POWER (7 pins), IR-LED-DRIVER (9 pins)
GND: TOP-LEVEL (5 pins), CAN-TRANSCEIVER (5 pins), POWER (20 pins), MCU (18 pins), OFS (17 pins), IMU (6 pins), IR-LED-DRIVER (22 pins)
24V_HARNESS: TOP-LEVEL (X1.1), POWER (D3.2 Q1.3 R5.2)
CAN_RX: CAN-TRANSCEIVER (U4.4), MCU (U1.44)
CAN_TX: CAN-TRANSCEIVER (U4.1), MCU (U1.45)
CRIT_CAN_H: TOP-LEVEL (X1.2), CAN-TRANSCEIVER (R7.2 U4.7)
CRIT_CAN_L: TOP-LEVEL (X1.3), CAN-TRANSCEIVER (R8.1 U4.6)
IMU_FSYNC: MCU (U1.39), IMU (U7.9)
IMU_INT1: MCU (U1.55), IMU (U7.4)
IMU_MISO: MCU (U1.35), IMU (U7.1)
IMU_MOSI: MCU (U1.36), IMU (U7.14)
IMU_NCS: MCU (U1.56), IMU (U7.12)
IMU_SCLK: MCU (U1.29), IMU (U7.13)
LED_FAULT: MCU (U1.9), IR-LED-DRIVER (R24.1 U8.8)
LED_ISMON: MCU (U1.24), IR-LED-DRIVER (U8.7)
LED_PWM: MCU (U1.16), IR-LED-DRIVER (R22.1 R23.1)
OFS_LDO_EN: MCU (U1.28), OFS (U3.3)
OFS_LED_PULSE: MCU (U1.14 U1.15), OFS (R28.1)
OFS_MISO: MCU (U1.52), OFS (R6.1 U2.12)
OFS_MOSI: MCU (U1.53), OFS (U2.11)
OFS_MOTION: MCU (U1.26), OFS (U2.9)
OFS_NCS: MCU (U1.4), OFS (U2.13)
OFS_NRESET: MCU (U1.27), OFS (U2.14)
OFS_SCLK: MCU (U1.51), OFS (U2.10)